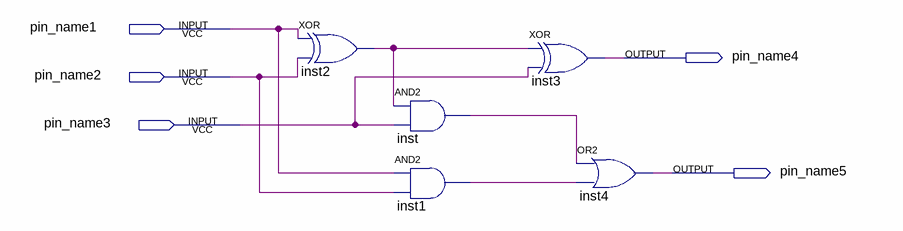
[diagram p0: schematic sheet]
// Quartus schematic ex5.bdf as structural Verilog: 5 symbols, 5 pins
module ex5 (
  input  pin_name1,
  input  pin_name2,
  input  pin_name3,
  output pin_name4,
  output pin_name5
);

  wire inst1_out, inst2_out, inst_out;

  xor inst2 (inst2_out, pin_name1, pin_name2);
  and inst (inst_out, inst2_out, pin_name3);
  and inst1 (inst1_out, pin_name1, pin_name2);
  xor inst3 (pin_name4, inst2_out, pin_name3);
  or inst4 (pin_name5, inst_out, inst1_out);
endmodule
